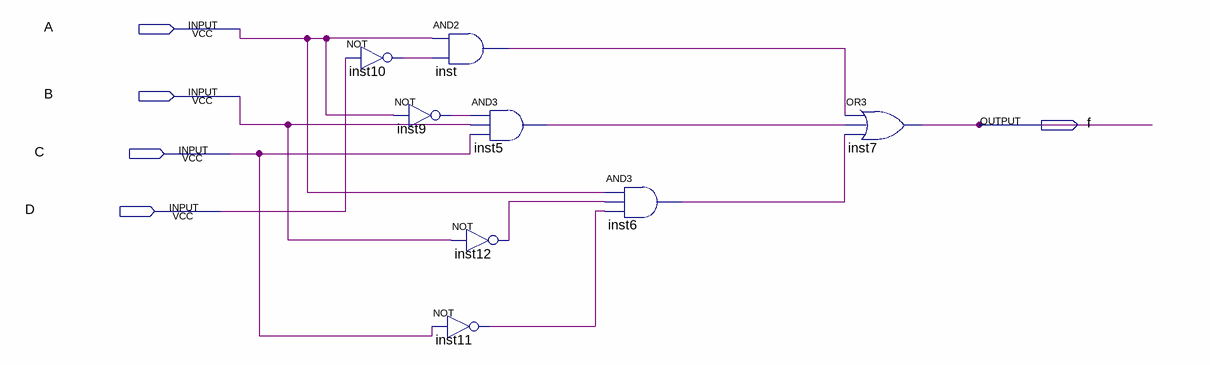
[diagram p0: schematic sheet]
// Quartus schematic Simulation.bdf as structural Verilog: 8 symbols, 5 pins
module Simulation (
  input  A,
  input  B,
  input  C,
  input  D,
  output f
);

  wire inst5_out, inst6_out, inst9_out, inst10_out, inst11_out, inst12_out, inst_out;

  not inst10 (inst10_out, D);
  not inst9 (inst9_out, A);
  and inst (inst_out, A, inst10_out);
  and inst5 (inst5_out, inst9_out, B, C);
  not inst12 (inst12_out, B);
  not inst11 (inst11_out, C);
  and inst6 (inst6_out, A, inst12_out, inst11_out);
  or inst7 (f, inst_out, inst5_out, inst6_out);
endmodule
